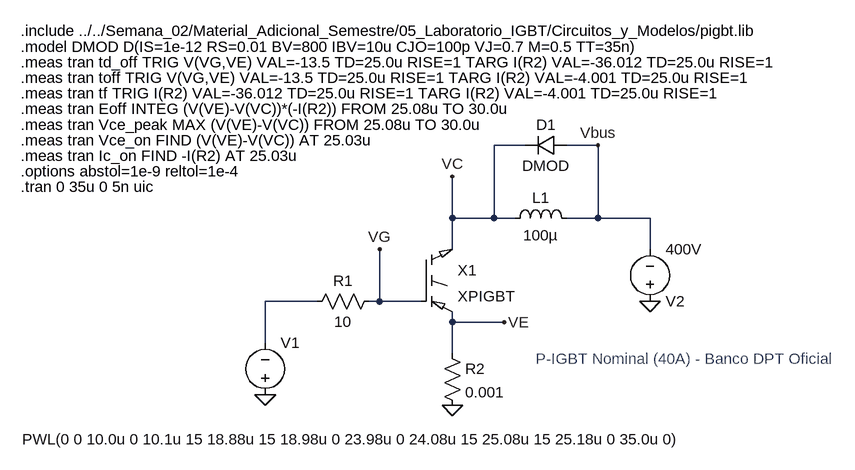
[diagram p0: schematic DPT_PIGBT_nom.asc]
DPT_PIGBT_nom.asc, the LTspice schematic file:
Version 4.1
SHEET 1 1820 680
WIRE 368 -64 320 -64
WIRE 480 -64 432 -64
WIRE 256 48 256 -16
WIRE 320 48 320 -64
WIRE 320 48 256 48
WIRE 352 48 320 48
WIRE 480 48 480 -64
WIRE 480 48 432 48
WIRE 560 48 480 48
WIRE 256 96 256 48
WIRE 560 96 560 48
WIRE 48 176 -32 176
WIRE 144 176 144 96
WIRE 144 176 128 176
WIRE 208 176 144 176
WIRE 256 208 256 192
WIRE 336 208 256 208
WIRE -32 240 -32 176
WIRE 256 256 256 208
FLAG -32 320 0
FLAG 256 336 0
FLAG 560 176 0
FLAG 144 96 VG
FLAG 256 -16 VC
FLAG 336 208 VE
FLAG 480 -64 Vbus
SYMBOL Misc\\PIGBT 208 96 R0
SYMATTR InstName X1
SYMATTR Value XPIGBT
SYMATTR Prefix X
SYMBOL diode 432 -80 R90
WINDOW 0 0 32 VBottom 2
WINDOW 3 32 32 VTop 2
SYMATTR InstName D1
SYMATTR Value DMOD
SYMBOL ind 336 64 R270
WINDOW 0 32 56 VTop 2
WINDOW 3 5 56 VBottom 2
SYMATTR InstName L1
SYMATTR Value 100µ
SYMATTR SpiceLine Rser=1m
SYMBOL res 144 160 R90
WINDOW 0 0 56 VBottom 2
WINDOW 3 32 56 VTop 2
SYMATTR InstName R1
SYMATTR Value 10
SYMBOL res 240 240 R0
SYMATTR InstName R2
SYMATTR Value 0.001
SYMBOL voltage -32 336 M180
WINDOW 3 -374 -52 Left 2
WINDOW 0 24 96 Left 2
SYMATTR Value PWL(0 0 10.0u 0 10.1u 15 18.88u 15 18.98u 0 23.98u 0 24.08u 15 25.08u 15 25.18u 0 35.0u 0)
SYMATTR InstName V1
SYMBOL voltage 560 192 M180
WINDOW 123 0 0 Left 0
WINDOW 39 0 0 Left 0
SYMATTR InstName V2
SYMATTR Value 400V
TEXT -408 -240 Left 2 !.include ../../Semana_02/Material_Adicional_Semestre/05_Laboratorio_IGBT/Circuitos_y_Modelos/pigbt.lib
TEXT -408 -216 Left 2 !.model DMOD D(IS=1e-12 RS=0.01 BV=800 IBV=10u CJO=100p VJ=0.7 M=0.5 TT=35n)
TEXT -408 0 Left 2 !.tran 0 35u 0 5n uic
TEXT -408 -24 Left 2 !.options abstol=1e-9 reltol=1e-4
TEXT -408 -48 Left 2 !.meas tran Ic_on FIND -I(R2) AT 25.03u
TEXT -408 -72 Left 2 !.meas tran Vce_on FIND (V(VE)-V(VC)) AT 25.03u
TEXT -408 -96 Left 2 !.meas tran Vce_peak MAX (V(VE)-V(VC)) FROM 25.08u TO 30.0u
TEXT -408 -192 Left 2 !.meas tran td_off TRIG V(VG,VE) VAL=-13.5 TD=25.0u RISE=1 TARG I(R2) VAL=-36.012 TD=25.0u RISE=1
TEXT -408 -144 Left 2 !.meas tran tf TRIG I(R2) VAL=-36.012 TD=25.0u RISE=1 TARG I(R2) VAL=-4.001 TD=25.0u RISE=1
TEXT -408 -168 Left 2 !.meas tran toff TRIG V(VG,VE) VAL=-13.5 TD=25.0u RISE=1 TARG I(R2) VAL=-4.001 TD=25.0u RISE=1
TEXT -408 -120 Left 2 !.meas tran Eoff INTEG (V(VE)-V(VC))*(-I(R2)) FROM 25.08u TO 30.0u
TEXT 384 264 Left 2 ;P-IGBT Nominal (40A) - Banco DPT Oficial

The netlist it stands for:
* DPT_PIGBT_nom.asc
X§X1 VC VG VE XPIGBT  ; pins C G E
D1 Vbus VC DMOD
L1 VC Vbus 100µ Rser=1m
R1 VG N001 10
R2 VE 0 0.001
V1 0 N001 PWL(0 0 10.0u 0 10.1u 15 18.88u 15 18.98u 0 23.98u 0 24.08u 15 25.08u 15 25.18u 0 35.0u 0)
V2 0 Vbus 400V
.model D D
.lib standard.dio
.include ../../Semana_02/Material_Adicional_Semestre/05_Laboratorio_IGBT/Circuitos_y_Modelos/pigbt.lib
.model DMOD D(IS=1e-12 RS=0.01 BV=800 IBV=10u CJO=100p VJ=0.7 M=0.5 TT=35n)
.tran 0 35u 0 5n uic
.options abstol=1e-9 reltol=1e-4
.meas tran Ic_on FIND -I(R2) AT 25.03u
.meas tran Vce_on FIND (V(VE)-V(VC)) AT 25.03u
.meas tran Vce_peak MAX (V(VE)-V(VC)) FROM 25.08u TO 30.0u
.meas tran td_off TRIG V(VG,VE) VAL=-13.5 TD=25.0u RISE=1 TARG I(R2) VAL=-36.012 TD=25.0u RISE=1
.meas tran tf TRIG I(R2) VAL=-36.012 TD=25.0u RISE=1 TARG I(R2) VAL=-4.001 TD=25.0u RISE=1
.meas tran toff TRIG V(VG,VE) VAL=-13.5 TD=25.0u RISE=1 TARG I(R2) VAL=-4.001 TD=25.0u RISE=1
.meas tran Eoff INTEG (V(VE)-V(VC))*(-I(R2)) FROM 25.08u TO 30.0u
* P-IGBT Nominal (40A) - Banco DPT Oficial
.backanno
.end